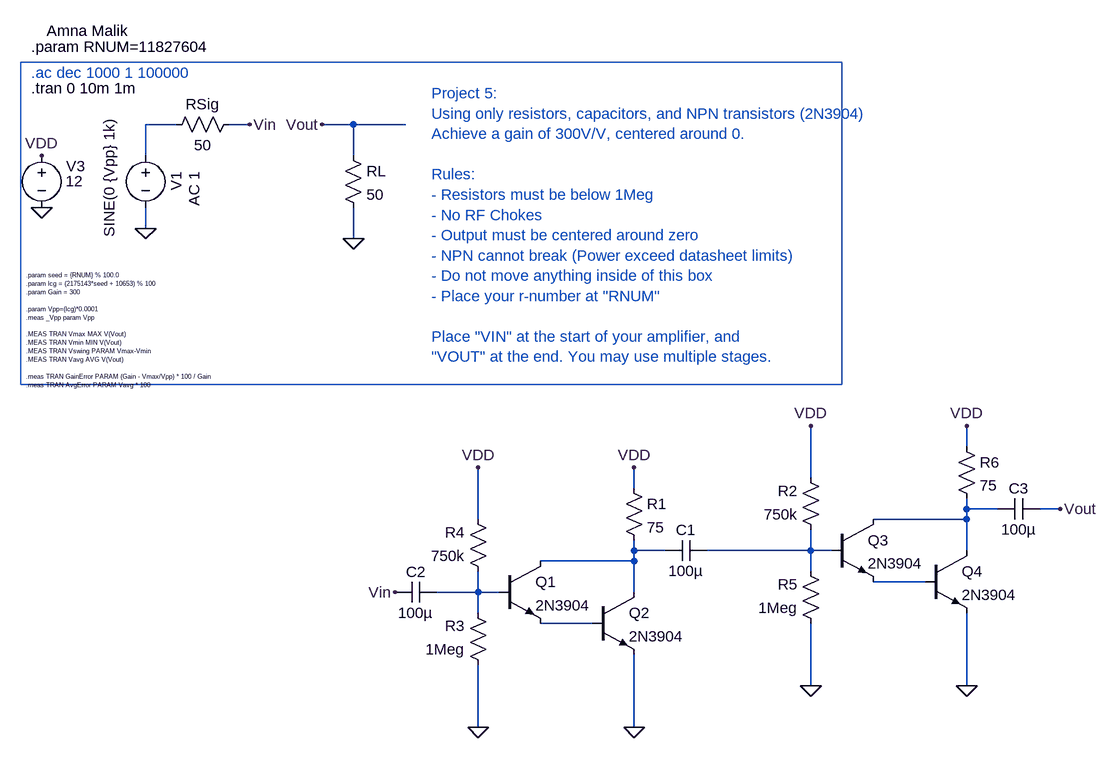
[diagram p0: schematic Project 5.asc]
Project 5.asc, the LTspice schematic file:
Version 4.1
SHEET 1 1304 1172
WIRE -336 144 -384 144
WIRE -224 144 -256 144
WIRE -64 144 -112 144
WIRE 16 144 -64 144
WIRE -384 192 -384 144
WIRE -64 192 -64 144
WIRE -384 304 -384 272
WIRE -64 320 -64 272
WIRE 880 640 880 608
WIRE 640 688 640 608
WIRE 368 704 368 672
WIRE 880 736 880 720
WIRE 928 736 880 736
WIRE 1024 736 992 736
WIRE 128 752 128 672
WIRE 880 752 880 736
WIRE 880 752 736 752
WIRE 368 800 368 784
WIRE 416 800 368 800
WIRE 640 800 640 768
WIRE 640 800 480 800
WIRE 672 800 640 800
WIRE 880 800 880 752
WIRE 368 816 368 800
WIRE 368 816 224 816
WIRE 640 832 640 800
WIRE 816 848 736 848
WIRE 128 864 128 832
WIRE 128 864 64 864
WIRE 160 864 128 864
WIRE 368 864 368 816
WIRE 128 896 128 864
WIRE 304 912 224 912
WIRE 640 1008 640 912
WIRE 880 1008 880 896
WIRE 128 1072 128 976
WIRE 368 1072 368 960
FLAG -384 304 0
FLAG -64 320 0
FLAG -544 272 0
FLAG -544 192 VDD
FLAG -224 144 Vin
FLAG -112 144 Vout
FLAG 128 672 VDD
FLAG 128 1072 0
FLAG 368 672 VDD
FLAG 0 864 Vin
FLAG 368 1072 0
FLAG 640 608 VDD
FLAG 640 1008 0
FLAG 880 608 VDD
FLAG 880 1008 0
FLAG 1024 736 Vout
SYMBOL voltage -384 176 R0
WINDOW 3 -56 -42 VRight 2
WINDOW 123 75 41 VRight 2
WINDOW 39 0 0 Left 0
WINDOW 0 47 41 VRight 2
SYMATTR Value SINE(0 {Vpp} 1k)
SYMATTR Value2 AC 1
SYMATTR InstName V1
SYMBOL res -80 176 R0
SYMATTR InstName RL
SYMATTR Value 50
SYMBOL res -240 128 R90
WINDOW 0 0 56 VBottom 2
WINDOW 3 32 56 VTop 2
SYMATTR InstName RSig
SYMATTR Value 50
SYMBOL voltage -544 176 R0
WINDOW 3 37 55 Left 2
WINDOW 123 0 0 Left 0
WINDOW 39 0 0 Left 0
WINDOW 0 38 32 Left 2
SYMATTR Value 12
SYMATTR InstName V3
SYMBOL npn 160 816 R0
SYMATTR InstName Q1
SYMATTR Value 2N3904
SYMBOL cap 64 848 R90
WINDOW 0 0 32 VBottom 2
WINDOW 3 32 32 VTop 2
SYMATTR InstName C2
SYMATTR Value 100µ
SYMBOL res 352 688 R0
SYMATTR InstName R1
SYMATTR Value 75
SYMBOL npn 304 864 R0
SYMATTR InstName Q2
SYMATTR Value 2N3904
SYMBOL cap 480 784 R90
WINDOW 0 0 32 VBottom 2
WINDOW 3 32 32 VTop 2
SYMATTR InstName C1
SYMATTR Value 100µ
SYMBOL npn 672 752 R0
SYMATTR InstName Q3
SYMATTR Value 2N3904
SYMBOL npn 816 800 R0
SYMATTR InstName Q4
SYMATTR Value 2N3904
SYMBOL cap 992 720 R90
WINDOW 0 0 32 VBottom 2
WINDOW 3 32 32 VTop 2
SYMATTR InstName C3
SYMATTR Value 100µ
SYMBOL res 144 992 R180
WINDOW 0 36 76 Left 2
WINDOW 3 36 40 Left 2
SYMATTR InstName R3
SYMATTR Value 1Meg
SYMBOL res 144 848 R180
WINDOW 0 36 76 Left 2
WINDOW 3 36 40 Left 2
SYMATTR InstName R4
SYMATTR Value 750k
SYMBOL res 656 784 R180
WINDOW 0 36 76 Left 2
WINDOW 3 36 40 Left 2
SYMATTR InstName R2
SYMATTR Value 750k
SYMBOL res 656 928 R180
WINDOW 0 36 76 Left 2
WINDOW 3 36 40 Left 2
SYMATTR InstName R5
SYMATTR Value 1Meg
SYMBOL res 864 624 R0
SYMATTR InstName R6
SYMATTR Value 75
TEXT -560 88 Left 2 !.tran 0 10m 1m
TEXT -560 64 Left 2 ;.ac dec 1000 1 100000
TEXT -560 24 Left 2 !.param RNUM=11827604
TEXT -568 376 Left 0 !.param seed = {RNUM} % 100.0\n.param lcg = (2175143*seed + 10653) % 100\n.param Gain = 300\n \n.param Vpp=(lcg)*0.0001\n.meas _Vpp param Vpp\n \n.MEAS TRAN Vmax MAX V(Vout)\n.MEAS TRAN Vmin MIN V(Vout)\n.MEAS TRAN Vswing PARAM Vmax-Vmin\n.MEAS TRAN Vavg AVG V(Vout)\n \n.meas TRAN GainError PARAM (Gain - Vmax/Vpp) * 100 / Gain\n.meas TRAN AvgError PARAM Vavg * 100
TEXT 56 96 Left 2 ;Project 5:\nUsing only resistors, capacitors, and NPN transistors (2N3904)\nAchieve a gain of 300V/V, centered around 0.\n \nRules:\n- Resistors must be below 1Meg\n- No RF Chokes\n- Output must be centered around zero\n- NPN cannot break (Power exceed datasheet limits)\n- Do not move anything inside of this box\n- Place your r-number at "RNUM"\n \nPlace "VIN" at the start of your amplifier, and\n"VOUT" at the end. You may use multiple stages.
TEXT -536 0 Left 2 !Amna Malik
RECTANGLE Normal 688 544 -576 48

The netlist it stands for:
* Project 5.asc
V1 N001 0 SINE(0 {Vpp} 1k) AC 1
RL Vout 0 50
RSig Vin N001 50
V3 VDD 0 12
Q1 N003 N006 N007 0 2N3904
C2 N006 Vin 100µ
R1 VDD N003 75
Q2 N003 N007 0 0 2N3904
C1 N004 N003 100µ
Q3 N002 N004 N005 0 2N3904
Q4 N002 N005 0 0 2N3904
C3 Vout N002 100µ
R3 0 N006 1Meg
R4 N006 VDD 750k
R2 N004 VDD 750k
R5 0 N004 1Meg
R6 VDD N002 75
.model NPN NPN
.model PNP PNP
.lib standard.bjt
.tran 0 10m 1m
* .ac dec 1000 1 100000
.param RNUM=11827604
.param seed = {RNUM} % 100.0
.param lcg = (2175143*seed + 10653) % 100
.param Gain = 300
.param Vpp=(lcg)*0.0001
.meas _Vpp param Vpp
.MEAS TRAN Vmax MAX V(Vout)
.MEAS TRAN Vmin MIN V(Vout)
.MEAS TRAN Vswing PARAM Vmax-Vmin
.MEAS TRAN Vavg AVG V(Vout)
.meas TRAN GainError PARAM (Gain - Vmax/Vpp) * 100 / Gain
.meas TRAN AvgError PARAM Vavg * 100
* Project 5:
* Using only resistors, capacitors, and NPN transistors (2N3904)
* Achieve a gain of 300V/V, centered around 0.
* Rules:
* - Resistors must be below 1Meg
* - No RF Chokes
* - Output must be centered around zero
* - NPN cannot break (Power exceed datasheet limits)
* - Do not move anything inside of this box
* - Place your r-number at "RNUM"
* Place "VIN" at the start of your amplifier, and
* "VOUT" at the end. You may use multiple stages.
Amna Malik
.backanno
.end